# Altium project actuator-driver.PrjPcb
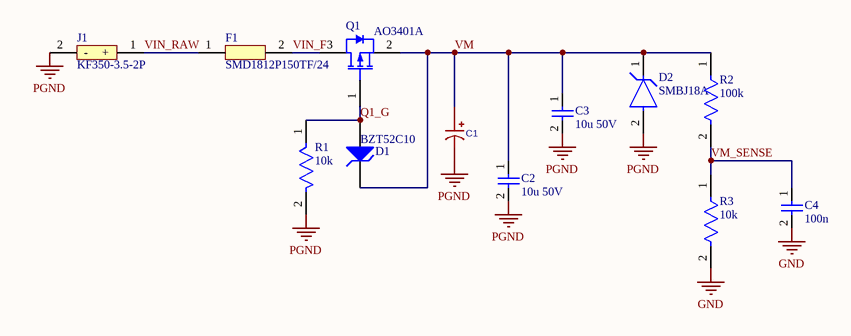
[diagram p0: actuator-driver.SchDoc]
6 sheets, 69 parts. Net scope: global (net labels, ports and power ports of the same name join across sheets).
Board file: actuator-driver.PcbDoc
Sheets:
  actuator-driver.SchDoc
  2_drv8316.SchDoc
  3_mcu.SchDoc
  4_encoder.SchDoc
  5_can.SchDoc
  6_connectors.SchDoc

## Sheet actuator-driver.SchDoc
size A4; SheetNumber: 1; SheetTotal: 6

### Parts
C1  RVT47UF50V67RV0029  [CAP_ELEC_6.3x7.7]  (value not drawn)
C2  10u 50V  [CAP_1206]
C3  10u 50V  [CAP_1206]
C4  100n  [RES_0603]
D1  BZT52C10  [SOD-123_MDD]
D2  SMBJ18A  [FP-SMBJ-MFG]
F1  SMD1812P150TF/24  [PTC_1812_RUILON]
J1  KF350-3.5-2P  [TERM_KF350_2P]
Q1  AO3401A  [AO-SOT-23-3L_V]
R1  10k  [RES_0603]
R2  100k  [RES_0603]
R3  10k  [RES_0603]

### Nets
GND: C4.2 R3.2
PGND: C1.2(-) C2.2 C3.2 D2.2(A) J1.2(-) R1.2
VM: C1.1(+) C2.1 C3.1 D1.2(K) D2.1(C) Q1.2(SOURCE) R2.1
Q1_G: D1.1(A) Q1.1(GATE) R1.1
VIN_F: F1.2 Q1.3(DRAIN)
VIN_RAW: F1.1 J1.1(+)
VM_SENSE: C4.1 R2.2 R3.1

### Library data of the parts
C1 = RVT47UF50V67RV0029: 47 uF 50 V aluminium electrolytic, 6.3x7.7; Manufacturer: KNSCHA(科尼盛); AddInBom: yes; ModelId: d5dd8793587942c3ae18823ce868290a; ModelName: CAP-SMD_BD6.3-L6.6-W6.6-H7.7; ModelTransform: 275.59,259.842,0,0,0,0,0,0,0; Value: 47uF; Tolerance: ±20%; Voltage Rating: 50V; Ripple Current: 70mA@120Hz; Lifetime: 2000hrs@105℃; Polarity type: Polarized; Symbol: RVT47UF50V67RV0029; LCSC Part Name: 47uF ±20% 50V; SupplierPart: C2887275; ManufacturerPart: RVT47UF50V67RV0029; Supplier Footprint: SMD,D6.3xL7.7mm; JLCPCB Part Class: Extended Part; Datasheet: https://item.szlcsc.com/datasheet/RVT47UF50V67RV0029/3103843.html; Supplier: LCSC; ConvertToPcb: yes; FootprintName: CAP-SMD_BD6.3-L6.6-W6.6-LS7.6-FD; Equivalent Series Resistance(ESR): -; Diameter: 6.3mm; Height - Seated (Max): 7.7mm; Operating Temperature: -55℃~+105℃
C2 C3 = CAP_1206: Capacitor, 1206; Value: 10u 50V
C4 = CAP_0603: Capacitor, 0603; Value: 100n
D1 = BZT52C10: Surface Mount Zener Diode, 10 V, SOD-123; Manufacturer: Changjing (CJ); LCSC: C2103
D2 = SMBJ18A: TVS DIODE 18V 29.2V DO214AA; Manufacturer: RUILON; Number Of Channels: 1; Max Junction Temp: +150°C; Breakdown Voltage: 20V; Peak Pulse Power: 600W; Direction: Unidirectional; Peak Pulse Current: 20.6A; RoHS: TRUE; ComponentLink2Description: Datasheet; Device Class L1: Circuit Protection; Manufacturer Part Number: SMBJ18A; Clamping Voltage: 29.2V; Height: 2.61mm; Temperature Range Low: -65°C; Temperature: -65°C to +150°C; Lead Free: Yes; Category: Diode; Reverse Standoff Voltage: 18V; Octopart: https://octopart.com/smbj18a-littelfuse-35303; ComponentLink2URL: https://www.littelfuse.com/~/media/electronics/datasheets/tvs_diodes/littelfuse_tvs_diode_smbj_datasheet.pdf.pdf; Package: SMBJ; Device Class L2: TVS Diodes; Automotive: No; Mouser Description: TVS Diodes - Transient Voltage Suppressors 18Vr 600W 20.6A 5% UniDirectional; Temperature Range High: +150°C; Device Class L3: unset; Digikey Description: TVS DIODE 18V 29.2V DO214AA; LCSC: C10212
F1 = SMD1812P150TF/24: PTC resettable fuse, 24 V, 1.5 A hold, 1812
J1 = KF350-3.5-2P: Screw terminal 2P 3.5 mm, power in
Q1 = AO3401A: P-Channel MOSFET, 30 V, 4 A, -55 to 150 degC, 3-Pin SOT-23-3L, RoHS, Tape and Reel; Manufacturer: Alpha and Omega; Output Power (Max): NotRequiredW; Power Dissipation: 1.4W; Rad Hardened: No; Drain Efficiency: NotRequired%; Drain-Source On-Volt: 30V; Noise Figure: NotRequireddB; Frequency (Max): NotRequiredMHz; Number of  Elements: 1; Gate-Source Voltage (Max): ?12V; Drain Current (Max): 4A; Channel Mode: Enhancement; Drain-Source On-Res: 0.044ohm; Type: PowerMOSFET; Polarity: P; Package URL: http://www.aosmd.com/res/packaging_information/SOT-23-3L.pdf; Datasheet URL: http://www.aosmd.com/res/data_sheets/AO3401A.pdf; Package Type: SOT-23; Package Description: 3-Pin Small Outline Transistor, Body 2.95 x 1.6 mm, Pitch 0.95 mm; Mounting: SurfaceMount; Manufacturer URL: http://www.aosmd.com/; Continuous Drain Current: 4A; Package Reference: SOT-23-3L; Mounting Technology: SurfaceMount; Operating Temperature Classification: Military; Power Gain: NotRequireddB; Datasheet Version: Rev. 3, 03/2011; Operating Temp Range: -55Cto150C; Pin Count: 3
R1-R3 = RES_0603: Resistor, 0603
  R1 R3: Value: 10k
  R2: Value: 100k

## Sheet 2_drv8316.SchDoc
size A4; SheetNumber: 2; SheetTotal: 6
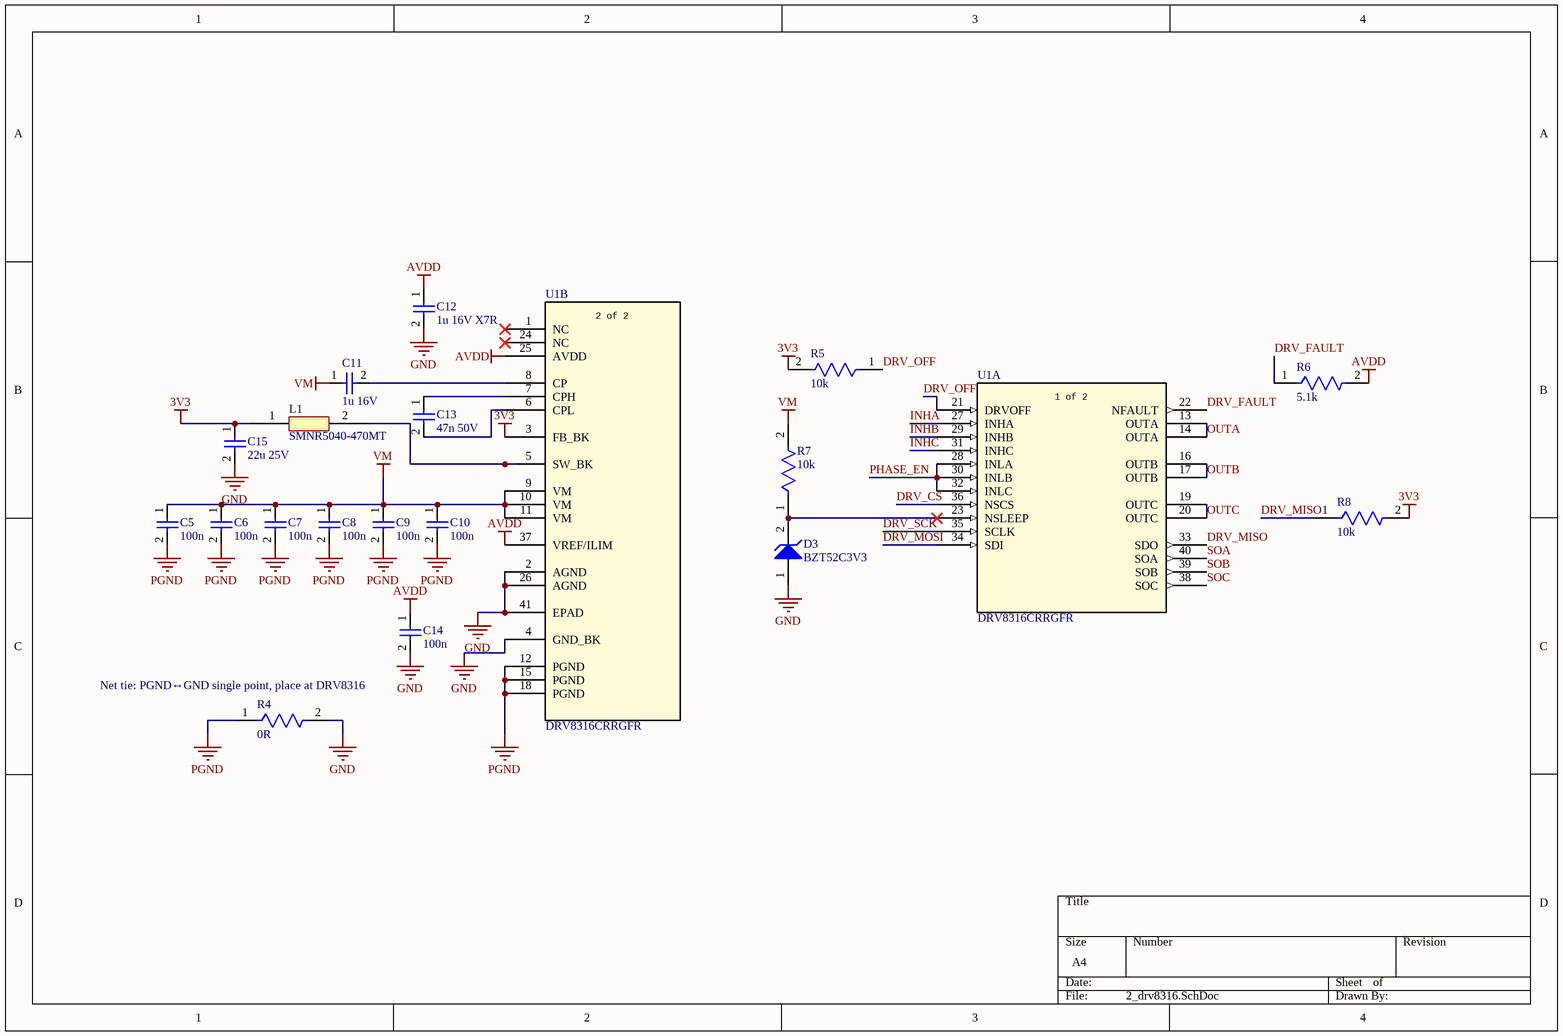
[diagram p1: 2_drv8316.SchDoc]

### Parts
C5  100n  [RES_0603]
C6  100n  [RES_0603]
C7  100n  [RES_0603]
C8  100n  [RES_0603]
C9  100n  [RES_0603]
C10  100n  [RES_0603]
C11  1u 16V  [RES_0603]
C12  1u 16V X7R  [RES_0603]
C13  47n 50V  [CAP_0402]
C14  100n  [RES_0603]
C15  22u 25V  [CAP_0805]
D3  BZT52C3V3  [SOD-123_MDD]
L1  SMNR5040-470MT  [SMNR5040]
R4  0R  [RES_0603]
R5  10k  [RES_0603]
R6  5.1k  [RES_0603]
R7  10k  [RES_0603]
R8  10k  [RES_0603]
U1  DRV8316CRRGFR  [VQFN40_RGF_TEX]  (parts A,B of 2)

### Nets
3V3: C15.1 L1.1 R5.2 R8.2 U1.3(FB_BK)
AVDD: C12.1 C14.1 R6.2 U1.25(AVDD) U1.37(VREF/ILIM)
GND: C12.2 C14.2 C15.2 D3.1(A) R4.2 U1.2(AGND) U1.4(GND_BK) U1.26(AGND) U1.41(EPAD)
PGND: C5.2 C6.2 C7.2 C8.2 C9.2 C10.2 R4.1 U1.12(PGND) U1.15(PGND) U1.18(PGND)
VM: C5.1 C6.1 C7.1 C8.1 C9.1 C10.1 C11.1 R7.2 U1.9(VM) U1.10(VM) U1.11(VM)
DRV_CS: U1.36(NSCS)
DRV_FAULT: R6.1 U1.22(NFAULT)
DRV_MISO: R8.1 U1.33(SDO)
DRV_MOSI: U1.34(SDI)
DRV_OFF: R5.1 U1.21(DRVOFF)
DRV_SCK: U1.35(SCLK)
INHA: U1.27(INHA)
INHB: U1.29(INHB)
INHC: U1.31(INHC)
OUTA: U1.13(OUTA) U1.14(OUTA)
OUTB: U1.16(OUTB) U1.17(OUTB)
OUTC: U1.19(OUTC) U1.20(OUTC)
PHASE_EN: U1.28(INLA) U1.30(INLB) U1.32(INLC)
SOA: U1.40(SOA)
SOB: U1.39(SOB)
SOC: U1.38(SOC)
NetC11_2: C11.2 U1.8(CP)
NetC13_1: C13.1 U1.7(CPH)
NetC13_2: C13.2 U1.6(CPL)
NetD3_2: D3.2(K) R7.1 U1.23(NSLEEP)
NetL1_2: L1.2 U1.5(SW_BK)

Not connected (* = marked no-connect by the designer): U1 1(NC)* 24(NC)*

### Notes on the sheet
- (near R4) Net tie: PGND↔GND single point, place at DRV8316
- (in symbol DRV8316CRRGFR, part A) 1 of 2
- (in symbol DRV8316CRRGFR, part B) 2 of 2

### Library data of the parts
C5-C12 C14 = CAP_0603: Capacitor, 0603
  C5-C10 C14: Value: 100n
  C11: Value: 1u 16V
  C12: Value: 1u 16V X7R
C13 = CAP_0402: Capacitor, 0402; MPN: CL05B473KB5VPNC; Manufacturer: Samsung Electro-Mechanics; Value: 47n 50V; LCSC: C307339
C15 = CAP_0805: Capacitor, 0805; Value: 22u 25V
D3 = BZT52C3V3: Surface Mount Zener Diode, 3.3 V, SOD-123; Manufacturer: MDD (Microdiode); LCSC: C173413
L1 = SMNR5040-470MT: 47 uH shielded power inductor, 5x5x4 mm
R4-R8 = RES_0603: Resistor, 0603
  R4: Value: 0R
  R5 R7 R8: Value: 10k
  R6: Value: 5.1k
U1 = DRV8316CRRGFR: 40-V max 8-A peak 3-phase motor driver with integrated current sensing, FETs, and enhanced CSA specs 40-VQFN -40 to 125; Manufacturer_Name: Texas Instruments; Type: Power Management; Copyright: Copyright (C) 2026 Ultra Librarian. All rights reserved.; Manufacturer_Part_Number: DRV8316CRRGFR; RefDes: RefDes

## Sheet 3_mcu.SchDoc
size A4; SheetNumber: 3; SheetTotal: 6
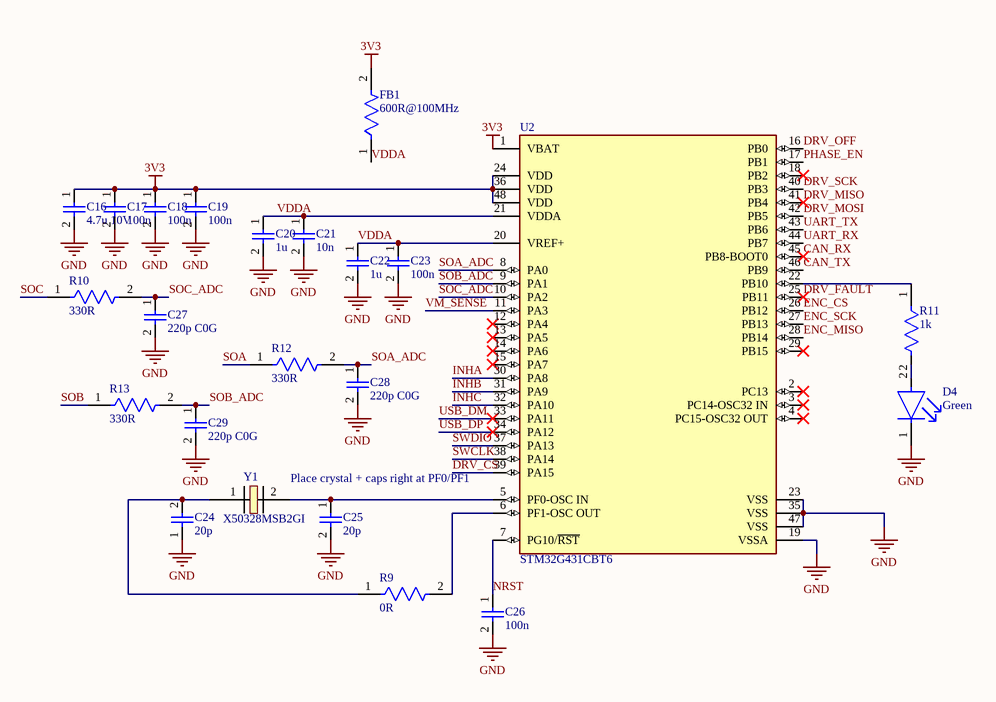
[diagram p2: 3_mcu.SchDoc]

### Parts
C16  4.7u 10V  [RES_0603]
C17  100n  [RES_0603]
C18  100n  [RES_0603]
C19  100n  [RES_0603]
C20  1u  [RES_0603]
C21  10n  [RES_0603]
C22  1u  [RES_0603]
C23  100n  [RES_0603]
C24  20p  [RES_0603]
C25  20p  [RES_0603]
C26  100n  [RES_0603]
C27  220p C0G  [RES_0603]
C28  220p C0G  [RES_0603]
C29  220p C0G  [RES_0603]
D4  Green  [LED_0603]
FB1  600R@100MHz  [RES_0603]
R9  0R  [RES_0603]
R10  330R  [RES_0603]
R11  1k  [RES_0603]
R12  330R  [RES_0603]
R13  330R  [RES_0603]
U2  STM32G431CBT6  [FP-LQFP48-5B-MFG]
Y1  X50328MSB2GI  [Crystal_5032_2P_YXC]

### Nets
3V3: C16.1 C17.1 C18.1 C19.1 FB1.2 U2.1(VBAT) U2.24(VDD) U2.36(VDD) U2.48(VDD)
GND: C16.2 C17.2 C18.2 C19.2 C20.2 C21.2 C22.2 C23.2 C24.1 C25.2 C26.2 C27.2 C28.2 C29.2 D4.1(C) U2.19(VSSA) U2.23(VSS) U2.35(VSS) U2.47(VSS)
CAN_RX: U2.45(PB8-BOOT0)
CAN_TX: U2.46(PB9)
DRV_CS: U2.39(PA15)
DRV_FAULT: U2.25(PB11)
DRV_MISO: U2.41(PB4)
DRV_MOSI: U2.42(PB5)
DRV_OFF: U2.16(PB0)
DRV_SCK: U2.40(PB3)
ENC_CS: U2.26(PB12)
ENC_MISO: U2.28(PB14)
ENC_SCK: U2.27(PB13)
INHA: U2.30(PA8)
INHB: U2.31(PA9)
INHC: U2.32(PA10)
NRST: C26.1 U2.7(PG10/~{RST})
PHASE_EN: U2.17(PB1)
SOA: R12.1
SOA_ADC: C28.1 R12.2 U2.8(PA0)
SOB: R13.1
SOB_ADC: C29.1 R13.2 U2.9(PA1)
SOC: R10.1
SOC_ADC: C27.1 R10.2 U2.10(PA2)
SWCLK: U2.38(PA14)
SWDIO: U2.37(PA13)
UART_RX: U2.44(PB7)
UART_TX: U2.43(PB6)
USB_DM: U2.33(PA11)
USB_DP: U2.34(PA12)
VDDA: C20.1 C21.1 C22.1 C23.1 FB1.1 U2.20(VREF+) U2.21(VDDA)
VM_SENSE: U2.11(PA3)
NetC24_2: C24.2 R9.1 Y1.1
NetC25_1: C25.1 U2.5(PF0-OSC_IN) Y1.2
NetD4_2: D4.2(A) R11.2
NetR9_2: R9.2 U2.6(PF1-OSC_OUT)
NetR11_1: R11.1 U2.22(PB10)

Not connected (* = marked no-connect by the designer): U2 2(PC13)* 3(PC14-OSC32_IN)* 4(PC15-OSC32_OUT)* 12(PA4)* 13(PA5)* 14(PA6)* 15(PA7)* 18(PB2)* 29(PB15)*

### Notes on the sheet
- (near U2) Place crystal + caps right at PF0/PF1

### Library data of the parts
C16-C29 = CAP_0603: Capacitor, 0603
  C16: Value: 4.7u 10V
  C17-C19 C23 C26: Value: 100n
  C20 C22: Value: 1u
  C21: Value: 10n
  C24 C25: Value: 20p
  C27-C29: Value: 220p C0G
D4 = LED_0603: LED, 0603; NexarPartId: 549907; Forward Voltage: 2V; Viewing Angle: 130°; Lens Transparency: Clear; Power Rating: 75mW; Number of LEDs: 1; Luminous Intensity: 35mcd; Forward Current: 20mA; Dominant Wavelength: 571nm; Lens Color: Clear, Colorless; Reverse Voltage: 5V; Wavelength: 574nm; Number of Pins: 2; Packaging: Tape and Reel; Number of Elements: 1; Schedule B: 8541402000, 8541402000|8541402000|8541402000|8541402000|8541402000; Height: 550µm; Case/Package: 0603; Illumination Color: Green; Depth: 800µm; Max Operating Temperature: 85°C; RoHS: Compliant; Lens Style: Clear; Lead Free: Lead Free; Length: 1.6mm; Mount: Surface Mount; Test Current: 20mA; Width: 800µm; Case Code (Imperial): 0603; Min Operating Temperature: -55°C; Case Code (Metric): 1608; Radiation Hardening: No; Power Dissipation: 75mW; Color: Green; Value: Green
FB1 = FB_0603: Ferrite bead, 0603; Value: 600R@100MHz
R9-R13 = RES_0603: Resistor, 0603
  R9: Value: 0R
  R10 R12 R13: Value: 330R
  R11: Value: 1k
U2 = STM32G431CBT6: MAINSTREAM ARM CORTEX-M4+ MCU 17; Manufacturer: STMicroelectronics; Number Of Adc Channels: 17; Number Of I/Os: 38; Standoff Height: 0.05mm; Number Of Usb Channels: 1; Data Bus Width: 32bits; Number Of I2C Channels: 3; Number Of Pwm Channels: 31; Frequency: 170MHz; Memory Type: FLASH; Number Of Timers/Counters: 14; Ram Size: 32KBytes; Max Junction Temp: +105°C; Memory Size: 128KBytes; Min Supply Voltage: 1.62V; Max Supply Voltage: 3.6V; Number Of Uart Channels: 4; Interface: I2C,SPI,UART,USART,CAN,USB,LIN,IrDA,I2S; Temperature Range Low: -40°C; Lead Free: Yes; Device Class L3: Microcontrollers; Number Of Cores: 1; Temperature Range High: +85°C; Height: 1.6mm; Digikey Description: MAINSTREAM ARM CORTEX-M4+ MCU 17; Device Class L1: Integrated Circuits (ICs); Package: LQFP48-5B; RoHS: TRUE; Number Of A/D Converters: 1; Core Architecture: Arm Cortex-M4; Device Class L2: Embedded Processors and Controllers; ComponentLink2Description: Datasheet; Temperature: -40°C to +85°C; Ambient Temperature Range High: +85°C; Ambient Temperature Range Low: -40°C; Octopart: https://octopart.com/stm32g431cbt6-stmicroelectronics-98835224; ComponentLink2URL: https://www.st.com/resource/en/datasheet/stm32g431cb.pdf; Automotive: No; Number Of Spi Channels: 3; Manufacturer Part Number: STM32G431CBT6; Category: IC
Y1 = X50328MSB2GI: 8 MHz crystal, 5032, 2-pad

## Sheet 4_encoder.SchDoc
size A4; SheetNumber: 4; SheetTotal: 6
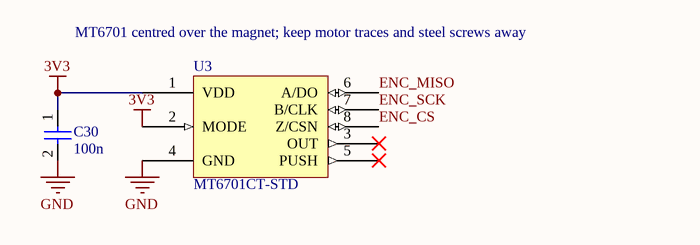
[diagram p3: 4_encoder.SchDoc]

### Parts
C30  100n  [RES_0603]
U3  MT6701CT-STD  [FP-D0008A-MFG]

### Nets
3V3: C30.1 U3.1(VDD) U3.2(MODE)
GND: C30.2 U3.4(GND)
ENC_CS: U3.8(Z/CSN)
ENC_MISO: U3.6(A/DO)
ENC_SCK: U3.7(B/CLK)

Not connected (* = marked no-connect by the designer): U3 3(OUT)* 5(PUSH)*

### Notes on the sheet
- (near U3) MT6701 centred over the magnet; keep motor traces and steel screws away

### Library data of the parts
C30 = CAP_0603: Capacitor, 0603; Value: 100n
U3 = MT6701CT-STD: Magnetic angle encoder, SOP-8

## Sheet 5_can.SchDoc
size A4; SheetNumber: 5; SheetTotal: 6
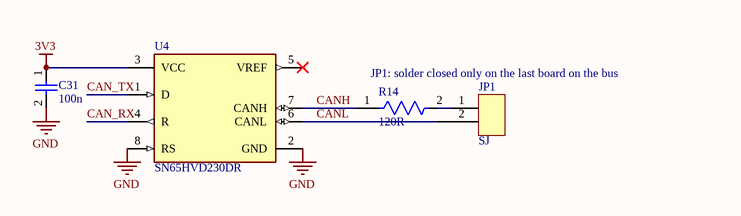
[diagram p4: 5_can.SchDoc]

### Parts
C31  100n  [RES_0603]
JP1  SJ  [SJ_2P]
R14  120R  [RES_0603]
U4  SN65HVD230DR  [FP-D0008A-MFG]

### Nets
3V3: C31.1 U4.3(VCC)
GND: C31.2 U4.2(GND) U4.8(RS)
CAN_RX: U4.4(R)
CAN_TX: U4.1(D)
CANH: R14.1 U4.7(CANH)
CANL: JP1.2 U4.6(CANL)
NetJP1_1: JP1.1 R14.2

Not connected (* = marked no-connect by the designer): U4 5(VREF)*

### Notes on the sheet
- JP1: solder closed only on the last board on the bus

### Library data of the parts
C31 = CAP_0603: Capacitor, 0603; Value: 100n
JP1 = SJ_2P: Solder jumper, 2-pad, open
R14 = RES_0603: Resistor, 0603; Value: 120R
U4 = SN65HVD230DR: IC TRANSCEIVER HALF 1/1 8SOIC; Number of Transceivers: 1; Operating Supply Voltage: 3.3V; Number of I/Os: 2; Max Supply Current: 17mA; Max Supply Voltage: 3.6V; Min Supply Voltage: 3V; Data Rate: 1Mbps; Min Operating Temperature: -40°C; Packaging: Tape and Reel; Lead Free: Lead Free; Number of Transmit Buffers: 1; Max Operating Temperature: 85°C; Number of Receive Buffers: 1; Number of Pins: 8; Package Quantity: 1; Radiation Hardening: No; Case/Package: D; REACH SVHC: No SVHC; Weight: 0.002561oz; Termination: SMD/SMT; Contact Plating: Gold; Nominal Supply Current: 17mA; Number of Receivers: 1; Number of Drivers: 1

## Sheet 6_connectors.SchDoc
size A4; SheetNumber: 6; SheetTotal: 6
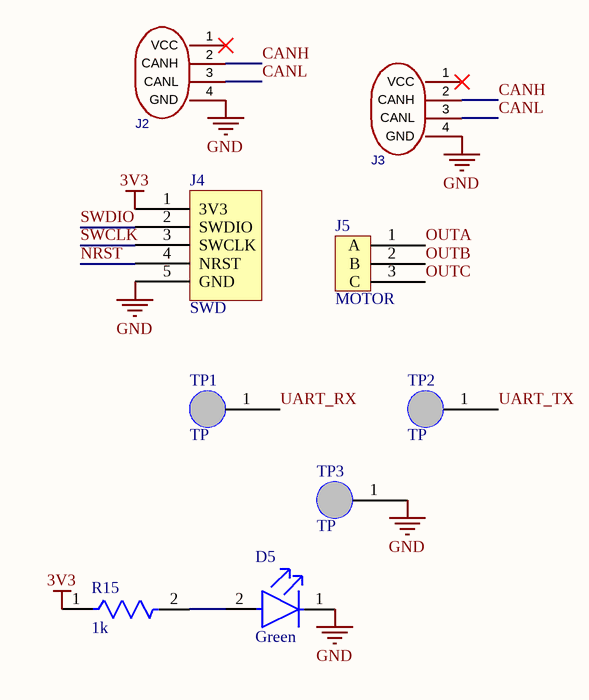
[diagram p5: 6_connectors.SchDoc]

### Parts
D5  Green  [LED_0603]
J2  SM04B-GHS-TB  [JST_GH_SM04B]  (value not drawn)
J3  SM04B-GHS-TB  [JST_GH_SM04B]  (value not drawn)
J4  SWD  [HDR_1x5_2.54]
J5  MOTOR  [MOTOR_PADS_3]
R15  1k  [RES_0603]
TP1  TP  [TP_1.5]
TP2  TP  [TP_1.5]
TP3  TP  [TP_1.5]

### Nets
3V3: J4.1(3V3) R15.1
GND: D5.1(C) J2.4(GND) J3.4(GND) J4.5(GND) TP3.1
CANH: J2.2(CANH) J3.2(CANH)
CANL: J2.3(CANL) J3.3(CANL)
NRST: J4.4(NRST)
OUTA: J5.1(A)
OUTB: J5.2(B)
OUTC: J5.3(C)
SWCLK: J4.3(SWCLK)
SWDIO: J4.2(SWDIO)
UART_RX: TP1.1
UART_TX: TP2.1
NetD5_2: D5.2(A) R15.2

Not connected (* = marked no-connect by the designer): J2 1(VCC)*; J3 1(VCC)*

### Library data of the parts
D5 = LED_0603: as D4 on sheet 3_mcu; Number of Pins: 2; Packaging: Tape and Reel; Number of Elements: 1; Schedule B: 8541402000, 8541402000|8541402000|8541402000|8541402000|8541402000; Height: 550µm; Case/Package: 0603; Illumination Color: Green; Depth: 800µm; Max Operating Temperature: 85°C; RoHS: Compliant; Lens Style: Clear; Lead Free: Lead Free; Length: 1.6mm; Mount: Surface Mount; Test Current: 20mA; Width: 800µm; Case Code (Imperial): 0603; Min Operating Temperature: -55°C; Case Code (Metric): 1608; Radiation Hardening: No; Power Dissipation: 75mW; Color: Green; Value: Green
J2 J3 = SM04B-GHS-TB: JST GH 4-pin side entry, CAN; Symbol: SM04B-GHS-TB(LF)(SN); AddInBom: yes; ModelId: b0352f6928cf4bf099b202a6090d3c8d; ModelName: CONN-SMD_GH1.25-WS-4P; ModelTransform: 324.8025,191.3382,0,0,0,0,0,-6.024,0; Pins Structure: 1x4P; Pitch: 1.25mm; Number of PINs Per Row: 4; Current Rating: 1A; Voltage Rating: 50V; Plastic Material: PA9T; Flame Retardant Rating: UL94V-0; Supplementary Features: Auxiliary Solder Pin; Z-Height of the Board: 4.25mm; X-Length of Bottom Edge on Board (Spacing Line): 8.25mm; Y-Width of Bottom Edge on Board: 4.13mm; LCSC Part Name: 1x4P 间距:1.25mm 卧贴 系列:GH; SupplierPart: C189895; Manufacturer: JST; ManufacturerPart: SM04B-GHS-TB(LF)(SN); Supplier Footprint: SMD,P=1.25mm,卧贴; JLCPCB Part Class: Extended Part; Datasheet: https://item.szlcsc.com/datasheet/SM04B-GHS-TB(LF)(SN)/207060.html; Supplier: LCSC; ConvertToPcb: yes; FootprintName: CONN-SMD_4P-P1.25_SM04B-GHS-TB-LF-SN; Mounting Type: Surface Mount, Right Angle; Reference Series: GH; Number of Pins: 4P; Number of Rows: 1; Row Spacing: -; Contact Material: Phosphor bronze; Contact Plating: Tin; Operating Temperature: -25℃~+85℃; Color: White
J4 = SWD: SWD header 1x5 2.54 mm
J5 = MOTOR_PADS_3: Motor phase solder pads
R15 = RES_0603: Resistor, 0603; Value: 1k
TP1-TP3 = TP_1.5: Test pad, 1.5 mm round

## Nets that join several sheets
3V3: 2_drv8316 (5 pins), 3_mcu (9 pins), 4_encoder (C30.1 U3.1 U3.2), 5_can (C31.1 U4.3), 6_connectors (J4.1 R15.1)
GND: actuator-driver (C4.2 R3.2), 2_drv8316 (9 pins), 3_mcu (19 pins), 4_encoder (C30.2 U3.4), 5_can (C31.2 U4.2 U4.8), 6_connectors (5 pins)
PGND: actuator-driver (6 pins), 2_drv8316 (10 pins)
VM: actuator-driver (7 pins), 2_drv8316 (11 pins)
CAN_RX: 3_mcu (U2.45), 5_can (U4.4)
CAN_TX: 3_mcu (U2.46), 5_can (U4.1)
CANH: 5_can (R14.1 U4.7), 6_connectors (J2.2 J3.2)
CANL: 5_can (JP1.2 U4.6), 6_connectors (J2.3 J3.3)
DRV_CS: 2_drv8316 (U1.36), 3_mcu (U2.39)
DRV_FAULT: 2_drv8316 (R6.1 U1.22), 3_mcu (U2.25)
DRV_MISO: 2_drv8316 (R8.1 U1.33), 3_mcu (U2.41)
DRV_MOSI: 2_drv8316 (U1.34), 3_mcu (U2.42)
DRV_OFF: 2_drv8316 (R5.1 U1.21), 3_mcu (U2.16)
DRV_SCK: 2_drv8316 (U1.35), 3_mcu (U2.40)
ENC_CS: 3_mcu (U2.26), 4_encoder (U3.8)
ENC_MISO: 3_mcu (U2.28), 4_encoder (U3.6)
ENC_SCK: 3_mcu (U2.27), 4_encoder (U3.7)
INHA: 2_drv8316 (U1.27), 3_mcu (U2.30)
INHB: 2_drv8316 (U1.29), 3_mcu (U2.31)
INHC: 2_drv8316 (U1.31), 3_mcu (U2.32)
NRST: 3_mcu (C26.1 U2.7), 6_connectors (J4.4)
OUTA: 2_drv8316 (U1.13 U1.14), 6_connectors (J5.1)
OUTB: 2_drv8316 (U1.16 U1.17), 6_connectors (J5.2)
OUTC: 2_drv8316 (U1.19 U1.20), 6_connectors (J5.3)
PHASE_EN: 2_drv8316 (U1.28 U1.30 U1.32), 3_mcu (U2.17)
SOA: 2_drv8316 (U1.40), 3_mcu (R12.1)
SOB: 2_drv8316 (U1.39), 3_mcu (R13.1)
SOC: 2_drv8316 (U1.38), 3_mcu (R10.1)
SWCLK: 3_mcu (U2.38), 6_connectors (J4.3)
SWDIO: 3_mcu (U2.37), 6_connectors (J4.2)
UART_RX: 3_mcu (U2.44), 6_connectors (TP1.1)
UART_TX: 3_mcu (U2.43), 6_connectors (TP2.1)
VM_SENSE: actuator-driver (C4.1 R2.2 R3.1), 3_mcu (U2.11)